# Altium schematic sheet Button_and_LEDs.SchDoc: User - Status LEDs
size A3; ApprovedBy: Weymen Koo; CheckedBy: -; DrawnBy: Weymen Koo; DocumentNumber: UBCAD-FCSOM-SCH; Revision: A; SheetNumber: 16; SheetTotal: 18; ProjectTitle: Flight Controller SoM; Status: PRELIMINARY; ReleaseDate: 2026-11-14
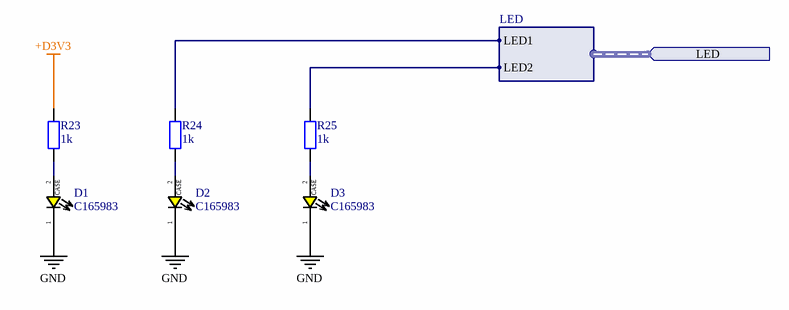
[diagram p0: Button_and_LEDs.SchDoc]

## Parts
D1  C165983  Package: CASE  [LED_0603_YELLOW]
D2  C165983  Package: CASE  [LED_0603_YELLOW]
D3  C165983  Package: CASE  [LED_0603_YELLOW]
R23  1k  [IPC C R0402 NO SILK]
R24  1k  [IPC C R0402 NO SILK]
R25  1k  [IPC C R0402 NO SILK]

## Ports
LED (in, harness LED, see 1[5D], 4[9D])

## Harnesses
LED: LED1, LED2

## Nets
+D3V3: R23.2
GND: D1.1 D2.1 D3.1
NetD1_2: D1.2 R23.1
NetD2_2: D2.2 R24.1
NetD3_2: D3.2 R25.1
NetR24_2: R24.2 ; port LED.LED1
NetR25_2: R25.2 ; port LED.LED2

## Notes on the sheet
- PROJECT
- KEY
- POWER
- 5 V class
- 3.3 V class
- Core / SMPS
- GND
- SHEET TITLE
- SIGNALS
- NOTES
- SPI
- Analog
- Design
- I2C
- PWM/Timer
- Layout
- UART/RC
- GPIO/Ctrl
- Assembly
- CAN
- Unused pin
- Firmware
- USB/SD/Clk
- Critical
- DRAWN
- DOCUMENT NO.
- CHECKED
- REV
- STATUS
- APPROVED
- DATE
- FILE
- SIZE
- A3
- SHEET
- of

## Library data of the parts
D1-D3 = CMP-006-000012-1: LED Yellow; Component Type: Standard; Design Item ID: LED_YELLOW; Color: Yellow; Source: CRLS Lib.SchLib; Pin Count: 2
R23-R25 = CMP-008-000000-2: RES 1k 1% 1/16W 0402; Manufacturer: UNI-ROYAL; Manufacturer Part Number: 0402WGF1001TCE; Value: 1k; Source: Schlib1.SchLib; Design Item ID: Generic RES 0402; Package: 0402; Tolerance: 1%; Power: 1/16W; LCSC Part #: C11702